# Altium schematic sheet Level_Shifter_Sec.SchDoc
size A4; DocumentNumber: 13; SheetNumber: 13; SheetTotal: 28
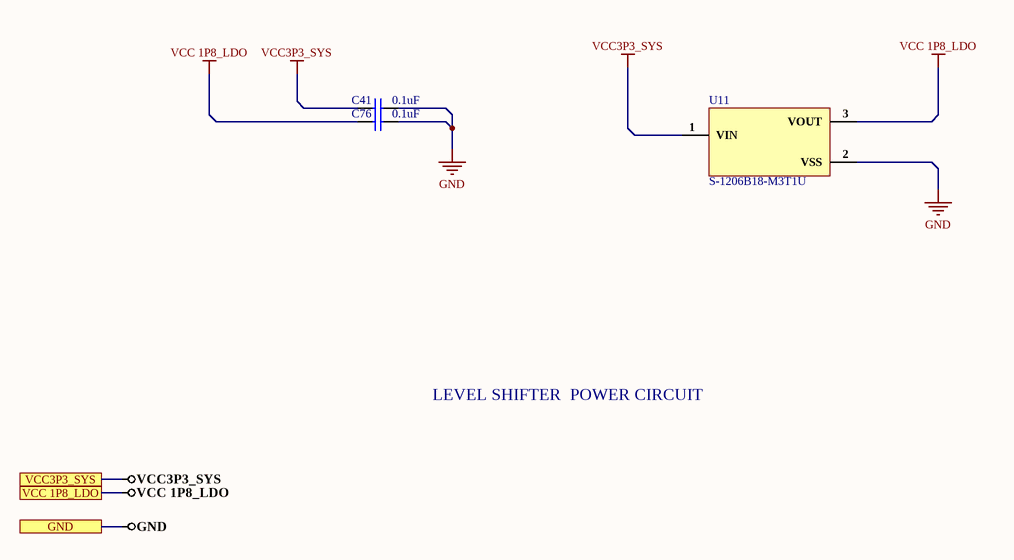
[diagram p0: Level_Shifter_Sec.SchDoc]

## Parts
C41  0.1uF  [Cap0603]
C76  0.1uF  [Cap0603]
U11  S-1206B18-M3T1U  [SOT-23]

## Ports
GND, VCC3P3_SYS, VCC 1P8_LDO

## Nets
GND: C41.2 C76.2 U11.2(VSS) ; port GND
VCC3P3_SYS: C41.1 U11.1(VIN) ; port VCC3P3_SYS
VCC 1P8_LDO: C76.1 U11.3(VOUT) ; port VCC 1P8_LDO

## Notes on the sheet
- LEVEL SHIFTER  POWER CIRCUIT

## Library data of the parts
C41 C76 = CC0603ZRY5V9BB104: CAP CER 0.1UF 50V Y5V 0603; Manufacturer: Yageo; Capacitance: 100nF; Tolerance: 80%; Supplier 1: Digi-Key; Manufacturer Part Number: CC0603ZRY5V9BB104; Stock 1: 15000880; Pricing 1: 1=0.1, 10=0.075, 100=0.0334, 500=0.02386, 1000=0.01874 (USD); Mount: Surface Mount; Case/Package: 0603; Number of Pins: 2; Case Code (Metric): 1608; Case Code (Imperial): 0603; Min Operating Temperature: -30°C; Max Operating Temperature: 85°C; Dielectric: Y5V; Voltage Rating: 50V; Package Quantity: 1; Packaging: Tape and Reel; Voltage Rating (DC): 50V; Termination: SMD/SMT; Composition: Ceramic; Voltage: 50V; Length: 1.6mm; Height: 0.8mm; Width: 0.031inch; Thickness: 0.035inch; Depth: 0.8mm; Radiation Hardening: No; REACH SVHC: No SVHC; Lead Free: Lead Free; Halogen Free: Halogen Free; ComponentLink1URL: http://www.yageo.com/documents/recent/UPY-GPHC_Y5V_6.3V-to-50V_8.pdf?src-supplier=Digi-Key; ComponentLink1Description: http://www.yageo.com/documents/recent/UPY-GPHC_Y5V_6.3V-to-50V_8.pdf?src-supplier=Digi-Key; ComponentLink2URL: http://www.yageo.com/documents/recent/UPY-GPHC_Y5V_6.3V-to-50V_5.pdf?src-supplier=Avnet+Europe; ComponentLink2Description: http://www.yageo.com/documents/recent/UPY-GPHC_Y5V_6.3V-to-50V_5.pdf?src-supplier=Avnet+Europe; ComponentLink3URL: https://www.verical.com/server-webapp/html/getDatasheet?partID=403611&src-supplier=Verical; ComponentLink3Description: https://www.verical.com/server-webapp/html/getDatasheet?partID=403611&src-supplier=Verical; ComponentLink4URL: http://www.mouser.com/ds/2/447/Yageo_UPY-GP_NP0_16V-to-50V_9-358835.pdf?src-supplier=Mouser; ComponentLink4Description: http://www.mouser.com/ds/2/447/Yageo_UPY-GP_NP0_16V-to-50V_9-358835.pdf?src-supplier=Mouser; ComponentLink5URL: http://www.farnell.com/datasheets/1132289.pdf?src-supplier=Element14; ComponentLink5Description: http://www.farnell.com/datasheets/1132289.pdf?src-supplier=Element14; Supplier Part Number 1: 311-1343-1-ND
U11 = S-1206B18-M3T1U: IC REG LINEAR 1.8V 250MA SOT23-3; Manufacturer: ABLIC; Supplier 1: Digi-Key; Manufacturer Part Number: S-1206B18-M3T1U; Stock 1: 577; Pricing 1: 1=0.92000, 10=0.80800, 25=0.75960, 100=0.57580, 250=0.49000, 500=0.46550 (USD); Supplier Part Number 1: 1662-1438-1-ND